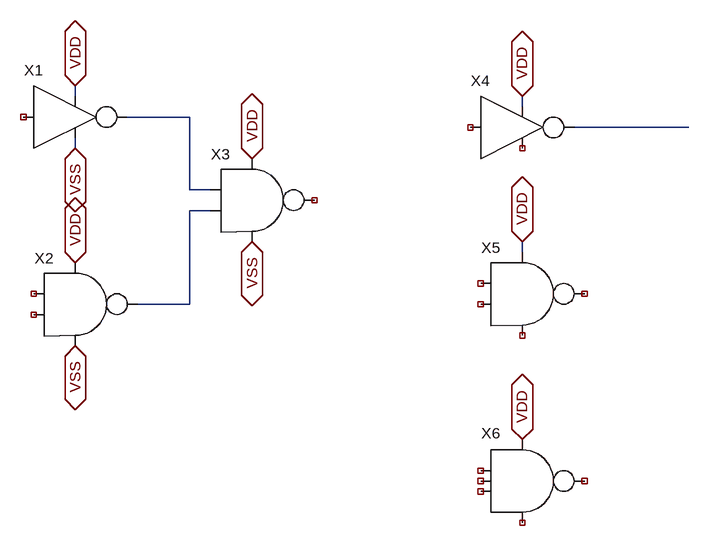
[diagram p0: schematic Draft4.asc]
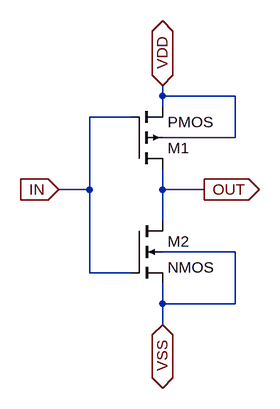
[diagram p1: sub-circuit inverter.asc]
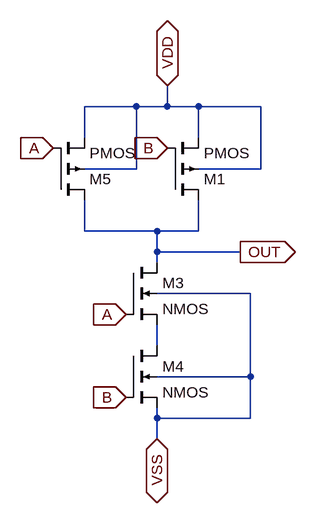
[diagram p2: sub-circuit nand2.asc]
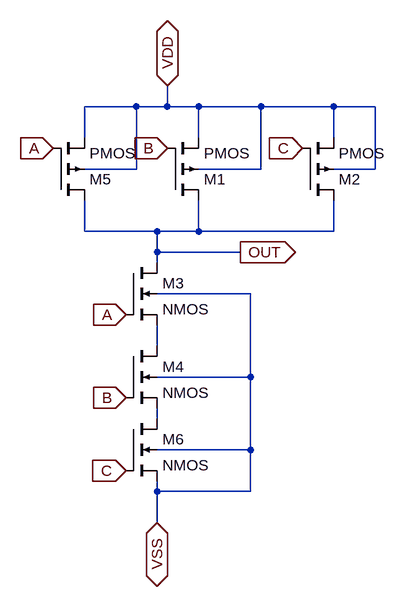
[diagram p3: sub-circuit nand3.asc]
Draft4.asc, the LTspice schematic file:
Version 4.1
SHEET 1 1240 680
WIRE 64 -160 64 -176
WIRE 752 -144 752 -160
WIRE 240 -128 144 -128
WIRE 1008 -112 832 -112
WIRE 64 -80 64 -96
WIRE 240 -16 240 -128
WIRE 272 -16 240 -16
WIRE 272 16 240 16
WIRE 752 80 752 64
WIRE 240 160 240 16
WIRE 240 160 160 160
FLAG 64 -176 VDD
IOPIN 64 -176 BiDir
FLAG 64 96 VDD
IOPIN 64 96 BiDir
FLAG 336 -64 VDD
IOPIN 336 -64 BiDir
FLAG 336 64 VSS
IOPIN 336 64 BiDir
FLAG 64 224 VSS
IOPIN 64 224 BiDir
FLAG 64 -80 VSS
IOPIN 64 -80 BiDir
FLAG 752 -160 VDD
IOPIN 752 -160 BiDir
FLAG 752 64 VDD
IOPIN 752 64 BiDir
FLAG 752 368 VDD
IOPIN 752 368 BiDir
SYMBOL INVERTER 48 -128 R0
SYMATTR InstName X1
SYMBOL NAND2 64 160 R0
SYMATTR InstName X2
SYMBOL NAND2 336 0 R0
SYMATTR InstName X3
SYMBOL INVERTER 736 -112 R0
SYMATTR InstName X4
SYMBOL NAND2 752 144 R0
SYMATTR InstName X5
SYMBOL NAND3 752 432 R0
SYMATTR InstName X6

inverter.asc, the sub-circuit schematic file:
Version 4.1
SHEET 1 880 680
WIRE 240 -272 240 -288
WIRE 352 -272 240 -272
WIRE 240 -256 240 -272
WIRE 192 -240 128 -240
WIRE 352 -208 352 -272
WIRE 352 -208 240 -208
WIRE 128 -128 128 -240
WIRE 128 -128 80 -128
WIRE 240 -128 240 -160
WIRE 304 -128 240 -128
WIRE 240 -80 240 -128
WIRE 352 -32 240 -32
WIRE 128 0 128 -128
WIRE 192 0 128 0
WIRE 240 48 240 16
WIRE 352 48 352 -32
WIRE 352 48 240 48
WIRE 240 80 240 48
FLAG 240 -288 VDD
IOPIN 240 -288 BiDir
FLAG 80 -128 IN
IOPIN 80 -128 In
FLAG 304 -128 OUT
IOPIN 304 -128 Out
FLAG 240 80 VSS
IOPIN 240 80 BiDir
SYMBOL pmos4 192 -160 M180
SYMATTR InstName M1
SYMBOL nmos4 192 -80 R0
SYMATTR InstName M2

nand2.asc, the sub-circuit schematic file:
Version 4.1
SHEET 1 880 680
WIRE 160 -688 80 -688
WIRE 208 -688 208 -720
WIRE 208 -688 160 -688
WIRE 256 -688 208 -688
WIRE 352 -688 256 -688
WIRE 80 -640 80 -688
WIRE 256 -640 256 -688
WIRE 160 -592 160 -688
WIRE 160 -592 80 -592
WIRE 352 -592 352 -688
WIRE 352 -592 256 -592
WIRE 80 -496 80 -544
WIRE 192 -496 80 -496
WIRE 256 -496 256 -544
WIRE 256 -496 192 -496
WIRE 192 -464 192 -496
WIRE 320 -464 192 -464
WIRE 192 -448 192 -464
WIRE 336 -400 192 -400
WIRE 192 -320 192 -352
WIRE 336 -272 336 -400
WIRE 336 -272 192 -272
WIRE 192 -208 192 -224
WIRE 336 -208 336 -272
WIRE 336 -208 192 -208
WIRE 192 -176 192 -208
FLAG 208 -720 VDD
IOPIN 208 -720 BiDir
FLAG 192 -176 VSS
IOPIN 192 -176 BiDir
FLAG 32 -624 A
IOPIN 32 -624 In
FLAG 208 -624 B
IOPIN 208 -624 In
FLAG 144 -368 A
IOPIN 144 -368 In
FLAG 144 -240 B
IOPIN 144 -240 In
FLAG 320 -464 OUT
IOPIN 320 -464 Out
SYMBOL nmos4 144 -448 R0
SYMATTR InstName M3
SYMBOL nmos4 144 -320 R0
SYMATTR InstName M4
SYMBOL pmos4 32 -544 M180
SYMATTR InstName M5
SYMBOL pmos4 208 -544 M180
SYMATTR InstName M1

nand3.asc, the sub-circuit schematic file:
Version 4.1
SHEET 1 880 680
WIRE 160 -688 80 -688
WIRE 208 -688 208 -720
WIRE 208 -688 160 -688
WIRE 256 -688 208 -688
WIRE 352 -688 256 -688
WIRE 464 -688 352 -688
WIRE 528 -688 464 -688
WIRE 80 -640 80 -688
WIRE 256 -640 256 -688
WIRE 464 -640 464 -688
WIRE 160 -592 160 -688
WIRE 160 -592 80 -592
WIRE 352 -592 352 -688
WIRE 352 -592 256 -592
WIRE 528 -592 528 -688
WIRE 528 -592 464 -592
WIRE 80 -496 80 -544
WIRE 192 -496 80 -496
WIRE 256 -496 256 -544
WIRE 256 -496 192 -496
WIRE 464 -496 464 -544
WIRE 464 -496 256 -496
WIRE 192 -464 192 -496
WIRE 320 -464 192 -464
WIRE 192 -448 192 -464
WIRE 336 -400 192 -400
WIRE 192 -320 192 -352
WIRE 336 -272 336 -400
WIRE 336 -272 192 -272
WIRE 192 -208 192 -224
WIRE 336 -160 336 -272
WIRE 336 -160 192 -160
WIRE 192 -96 192 -112
WIRE 336 -96 336 -160
WIRE 336 -96 192 -96
WIRE 192 -48 192 -96
FLAG 208 -720 VDD
IOPIN 208 -720 BiDir
FLAG 192 -48 VSS
IOPIN 192 -48 BiDir
FLAG 32 -624 A
IOPIN 32 -624 In
FLAG 208 -624 B
IOPIN 208 -624 In
FLAG 144 -368 A
IOPIN 144 -368 In
FLAG 144 -240 B
IOPIN 144 -240 In
FLAG 320 -464 OUT
IOPIN 320 -464 Out
FLAG 416 -624 C
IOPIN 416 -624 In
FLAG 144 -128 C
IOPIN 144 -128 In
SYMBOL nmos4 144 -448 R0
SYMATTR InstName M3
SYMBOL nmos4 144 -320 R0
SYMATTR InstName M4
SYMBOL pmos4 32 -544 M180
SYMATTR InstName M5
SYMBOL pmos4 208 -544 M180
SYMATTR InstName M1
SYMBOL pmos4 416 -544 M180
SYMATTR InstName M2
SYMBOL nmos4 144 -208 R0
SYMATTR InstName M6

The netlist it stands for:
* Draft4.asc
X§X1 NC_01 N001 VDD VSS inverter
X§X2 NC_02 NC_03 N003 VDD VSS nand2
X§X3 N001 N003 NC_04 VDD VSS nand2
X§X4 NC_05 N002 VDD NC_06 inverter
X§X5 NC_07 NC_08 NC_09 VDD NC_10 nand2
X§X6 NC_11 NC_12 NC_13 NC_14 VDD NC_15 nand3

* block symbol definitions
.subckt inverter IN OUT VDD VSS
M1 OUT IN VDD VDD PMOS
M2 OUT IN VSS VSS NMOS
.ends inverter

.subckt nand2 A B OUT VDD VSS
M3 OUT A N001 VSS NMOS
M4 N001 B VSS VSS NMOS
M5 OUT A VDD VDD PMOS
M1 OUT B VDD VDD PMOS
.ends nand2

.subckt nand3 A B C OUT VDD VSS
M3 OUT A N001 VSS NMOS
M4 N001 B N002 VSS NMOS
M5 OUT A VDD VDD PMOS
M1 OUT B VDD VDD PMOS
M2 OUT C VDD VDD PMOS
M6 N002 C VSS VSS NMOS
.ends nand3

.model NMOS NMOS
.model PMOS PMOS
.lib standard.mos
.backanno
.end